# Altium project Flex-LED-Board_v2.1.PrjPcb
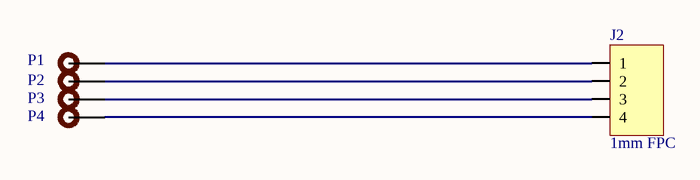
[diagram p0: Flex-LED.SchDoc]
1 sheet, 5 parts. Net scope: global (net labels, ports and power ports of the same name join across sheets).
Board file: PCB_Flex_LED_v2.1.PcbDoc

## Sheet Flex-LED.SchDoc
size A; SheetNumber: 1; SheetTotal: 1

### Parts
J2  1mm FPC  [FPC-1mm-4P - New]
P1  0.5mm Test Pad  [0.5mm Test Pad]  (value not drawn)  (no BOM)
P2  0.5mm Test Pad  [0.5mm Test Pad]  (value not drawn)  (no BOM)
P3  0.5mm Test Pad  [0.5mm Test Pad]  (value not drawn)  (no BOM)
P4  0.5mm Test Pad  [0.5mm Test Pad]  (value not drawn)  (no BOM)

### Nets
NetJ2_1: J2.1 P1.1
NetJ2_2: J2.2 P2.1
NetJ2_3: J2.3 P3.1
NetJ2_4: J2.4 P4.1

### Library data of the parts
J2 = FPC-1mm-4P-New: 1mm Pitch 4P FPC
P1-P4 = 0.5mm Test Pad: Test pad